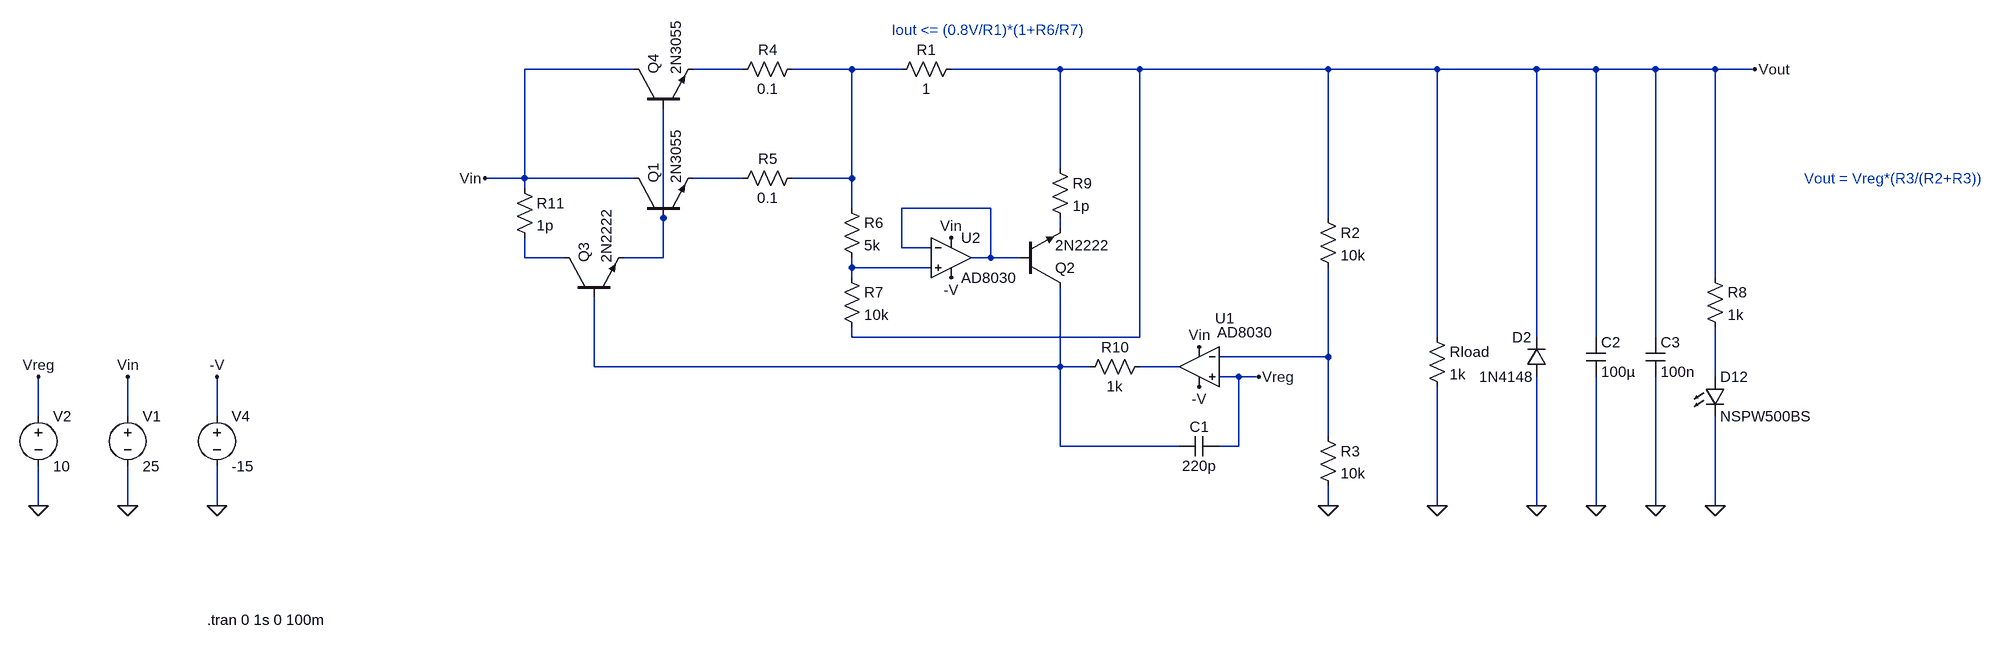
[diagram p0: schematic ALimentatore.asc]
ALimentatore.asc, the LTspice schematic file:
Version 4
SHEET 1 3308 680
WIRE 176 -320 0 -320
WIRE 352 -320 272 -320
WIRE 528 -320 432 -320
WIRE 608 -320 528 -320
WIRE 864 -320 688 -320
WIRE 992 -320 864 -320
WIRE 1296 -320 992 -320
WIRE 1472 -320 1296 -320
WIRE 1632 -320 1472 -320
WIRE 1728 -320 1632 -320
WIRE 1824 -320 1728 -320
WIRE 1920 -320 1824 -320
WIRE 1984 -320 1920 -320
WIRE 864 -160 864 -320
WIRE 0 -144 0 -320
WIRE 0 -144 -64 -144
WIRE 176 -144 0 -144
WIRE 352 -144 272 -144
WIRE 528 -144 528 -320
WIRE 528 -144 432 -144
WIRE 0 -128 0 -144
WIRE 528 -96 528 -144
WIRE 752 -96 608 -96
WIRE 224 -80 224 -256
WIRE 1296 -80 1296 -320
WIRE 864 -64 864 -80
WIRE 608 -32 608 -96
WIRE 656 -32 608 -32
WIRE 0 -16 0 -48
WIRE 64 -16 0 -16
WIRE 224 -16 224 -80
WIRE 224 -16 160 -16
WIRE 752 -16 752 -96
WIRE 752 -16 720 -16
WIRE 800 -16 752 -16
WIRE 528 0 528 -16
WIRE 656 0 528 0
WIRE 528 16 528 0
WIRE 1920 16 1920 -320
WIRE 528 112 528 96
WIRE 992 112 992 -320
WIRE 992 112 528 112
WIRE 1472 112 1472 -320
WIRE 1632 112 1632 -320
WIRE 1728 112 1728 -320
WIRE 1824 112 1824 -320
WIRE 1296 144 1296 0
WIRE 1296 144 1120 144
WIRE 112 160 112 48
WIRE 864 160 864 32
WIRE 864 160 112 160
WIRE 912 160 864 160
WIRE 1056 160 992 160
WIRE 1152 176 1120 176
WIRE 1184 176 1152 176
WIRE 1920 176 1920 96
WIRE -784 240 -784 176
WIRE -640 240 -640 176
WIRE -496 240 -496 176
WIRE 1296 272 1296 144
WIRE 864 288 864 160
WIRE 1056 288 864 288
WIRE 1152 288 1152 176
WIRE 1152 288 1120 288
WIRE -784 384 -784 320
WIRE -640 384 -640 320
WIRE -496 384 -496 320
WIRE 1296 384 1296 352
WIRE 1472 384 1472 192
WIRE 1632 384 1632 176
WIRE 1728 384 1728 176
WIRE 1824 384 1824 176
WIRE 1920 384 1920 240
FLAG 1088 192 -V
FLAG -64 -144 Vin
FLAG 1296 384 0
FLAG 1472 384 0
FLAG 1984 -320 Vout
FLAG 1632 384 0
FLAG 1728 384 0
FLAG 1824 384 0
FLAG 1920 384 0
FLAG -784 176 Vreg
FLAG -784 384 0
FLAG 1184 176 Vreg
FLAG 1088 128 Vin
FLAG -640 176 Vin
FLAG -640 384 0
FLAG -496 176 -V
FLAG -496 384 0
FLAG 688 16 -V
FLAG 688 -48 Vin
SYMBOL opamps\\AD8030 1088 96 M0
WINDOW 0 -57 -14 Left 2
WINDOW 3 -116 8 Left 2
SYMATTR InstName U1
SYMBOL npn 176 -80 R270
SYMATTR InstName Q1
SYMATTR Value 2N3055
SYMBOL npn 800 32 M180
SYMATTR InstName Q2
SYMATTR Value 2N2222
SYMBOL res 704 -336 R90
WINDOW 0 0 56 VBottom 2
WINDOW 3 32 56 VTop 2
SYMATTR InstName R1
SYMATTR Value 1
SYMBOL res 1280 -96 R0
SYMATTR InstName R2
SYMATTR Value 10k
SYMBOL res 1280 256 R0
SYMATTR InstName R3
SYMATTR Value 10k
SYMBOL res 1456 96 R0
SYMATTR InstName Rload
SYMATTR Value 1k
SYMBOL npn 64 48 R270
SYMATTR InstName Q3
SYMATTR Value 2N2222
SYMBOL npn 176 -256 R270
SYMATTR InstName Q4
SYMATTR Value 2N3055
SYMBOL res 448 -336 R90
WINDOW 0 0 56 VBottom 2
WINDOW 3 32 56 VTop 2
SYMATTR InstName R4
SYMATTR Value 0.1
SYMBOL res 448 -160 R90
WINDOW 0 0 56 VBottom 2
WINDOW 3 32 56 VTop 2
SYMATTR InstName R5
SYMATTR Value 0.1
SYMBOL diode 1648 176 R180
WINDOW 0 24 64 Left 2
WINDOW 3 24 0 Left 2
SYMATTR InstName D2
SYMATTR Value 1N4148
SYMBOL cap 1712 112 R0
SYMATTR InstName C2
SYMATTR Value 100µ
SYMBOL cap 1808 112 R0
SYMATTR InstName C3
SYMATTR Value 100n
SYMBOL LED 1904 176 R0
SYMATTR InstName D12
SYMATTR Value NSPW500BS
SYMATTR Description Diode
SYMATTR Type diode
SYMBOL res 1904 0 R0
SYMATTR InstName R8
SYMATTR Value 1k
SYMBOL res -16 -144 R0
SYMATTR InstName R11
SYMATTR Value 1p
SYMBOL voltage -784 224 R0
WINDOW 123 0 0 Left 0
WINDOW 39 0 0 Left 0
SYMATTR InstName V2
SYMATTR Value 10
SYMBOL voltage -640 224 R0
WINDOW 123 0 0 Left 0
WINDOW 39 0 0 Left 0
SYMATTR InstName V1
SYMATTR Value 25
SYMBOL voltage -496 224 R0
WINDOW 123 0 0 Left 0
WINDOW 39 0 0 Left 0
SYMATTR InstName V4
SYMATTR Value -15
SYMBOL res 512 -112 R0
SYMATTR InstName R6
SYMATTR Value 5k
SYMBOL res 512 0 R0
SYMATTR InstName R7
SYMATTR Value 10k
SYMBOL opamps\\AD8030 688 -80 R0
SYMATTR InstName U2
SYMBOL res 848 -176 R0
SYMATTR InstName R9
SYMATTR Value 1p
SYMBOL res 1008 144 R90
WINDOW 0 0 56 VBottom 2
WINDOW 3 32 56 VTop 2
SYMATTR InstName R10
SYMATTR Value 1k
SYMBOL cap 1120 272 R90
WINDOW 0 0 32 VBottom 2
WINDOW 3 32 32 VTop 2
SYMATTR InstName C1
SYMATTR Value 220p
TEXT -512 568 Left 2 !.tran 0 1s 0 100m
TEXT 2064 -144 Left 2 ;Vout = Vreg*(R3/(R2+R3))
TEXT 592 -384 Left 2 ;Iout <= (0.8V/R1)*(1+R6/R7)

The netlist it stands for:
* ALimentatore.asc
XU1 Vreg N009 Vin -V N011 AD8040  ; AD8030, pins In+ In- V+ V- OUT
Q1 Vin N005 N003 0 2N3055
Q2 N010 N004 N006 0 2N2222
R1 Vout N002 1
R2 Vout N009 10k
R3 N009 0 10k
Rload Vout 0 1k
Q3 N007 N010 N005 0 2N2222
Q4 Vin N005 N001 0 2N3055
R4 N002 N001 0.1
R5 N002 N003 0.1
D2 0 Vout 1N4148
C2 Vout 0 100µ
C3 Vout 0 100n
D12 N012 0 NSPW500BS
R8 Vout N012 1k
R11 Vin N007 1p
V2 Vreg 0 10
V1 Vin 0 25
V4 -V 0 -15
R6 N002 N008 5k
R7 N008 Vout 10k
XU2 N008 N004 Vin -V N004 AD8040  ; AD8030, pins In+ In- V+ V- OUT
R9 Vout N006 1p
R10 N011 N010 1k
C1 Vreg N010 220p
.model D D
.lib standard.dio
.model NPN NPN
.model PNP PNP
.lib standard.bjt
.tran 0 1s 0 100m
* Vout = Vreg*(R3/(R2+R3))
* Iout <= (0.8V/R1)*(1+R6/R7)
.lib ADI.lib
.backanno
.end